# Altium schematic sheet 31_Ruedas.SchDoc
size A4; SheetNumber: 7; SheetTotal: 16
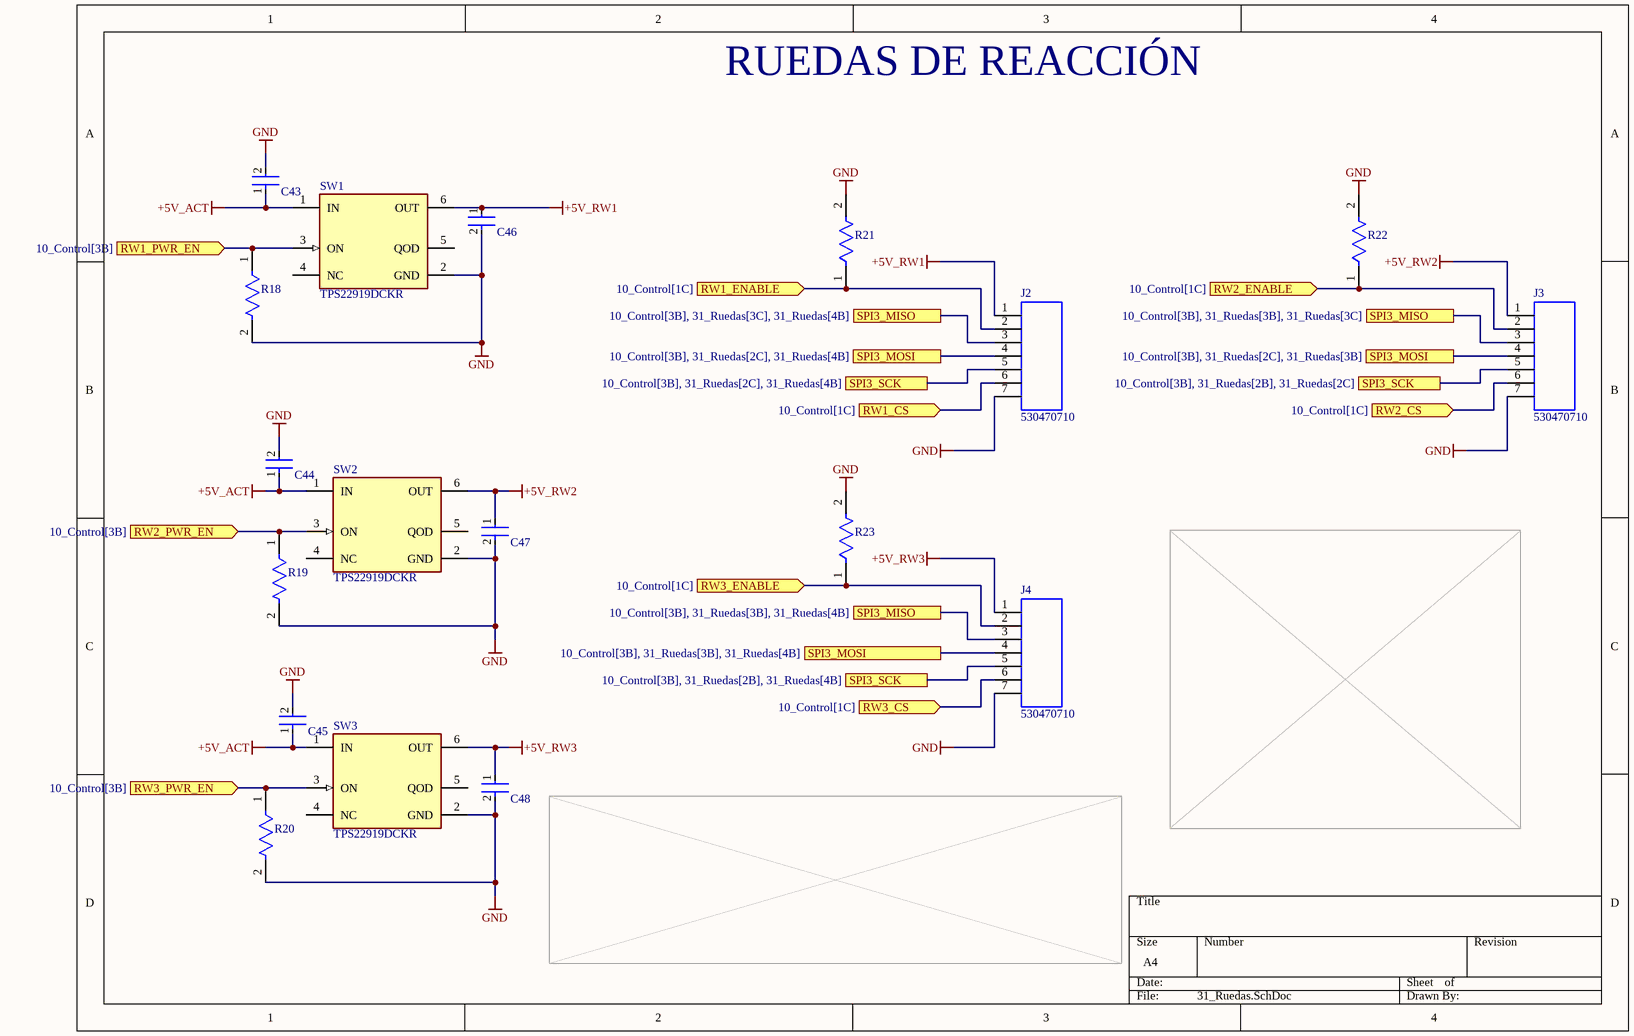
[diagram p0: 31_Ruedas.SchDoc]

## Parts
C43  C0603C104K3RACTU  [FP-C0603C-CF-IPC_B]  (value not drawn)
C44  C0603C104K3RACTU  [FP-C0603C-CF-IPC_B]  (value not drawn)
C45  C0603C104K3RACTU  [FP-C0603C-CF-IPC_B]  (value not drawn)
C46  GCM32ER71E106KA57K  [FP-GCM32E-0_3-IPC_B]  (value not drawn)
C47  GCM32ER71E106KA57K  [FP-GCM32E-0_3-IPC_B]  (value not drawn)
C48  GCM32ER71E106KA57K  [FP-GCM32E-0_3-IPC_B]  (value not drawn)
J2  530470710  [CONN07_530470710_MOL]
J3  530470710  [CONN07_530470710_MOL]
J4  530470710  [CONN07_530470710_MOL]
R18  RC0603FR-07100KL  [FP-RC0603-0_55-MFG]  (value not drawn)
R19  RC0603FR-07100KL  [FP-RC0603-0_55-MFG]  (value not drawn)
R20  RC0603FR-07100KL  [FP-RC0603-0_55-MFG]  (value not drawn)
R21  RC0603FR-07100KL  [FP-RC0603-0_55-MFG]  (value not drawn)
R22  RC0603FR-07100KL  [FP-RC0603-0_55-MFG]  (value not drawn)
R23  RC0603FR-07100KL  [FP-RC0603-0_55-MFG]  (value not drawn)
SW1  TPS22919DCKR  [FP-DCK0006A-IPC_A]
SW2  TPS22919DCKR  [FP-DCK0006A-IPC_A]
SW3  TPS22919DCKR  [FP-DCK0006A-IPC_A]

## Ports
RW1_CS (in, see 10_Control[1C]), RW1_ENABLE (in, see 10_Control[1C]), RW1_PWR_EN (in, see 10_Control[3B]), RW2_CS (in, see 10_Control[1C]), RW2_ENABLE (in, see 10_Control[1C]), RW2_PWR_EN (in, see 10_Control[3B]), RW3_CS (in, see 10_Control[1C]), RW3_ENABLE (in, see 10_Control[1C]), RW3_PWR_EN (in, see 10_Control[3B]), SPI3_MISO (see 10_Control[3B], 31_Ruedas[3B], 31_Ruedas[3C]), SPI3_MISO (see 10_Control[3B], 31_Ruedas[3B], 31_Ruedas[4B]), SPI3_MISO (see 10_Control[3B], 31_Ruedas[3C], 31_Ruedas[4B]), SPI3_MOSI (see 10_Control[3B], 31_Ruedas[2C], 31_Ruedas[3B]), SPI3_MOSI (see 10_Control[3B], 31_Ruedas[2C], 31_Ruedas[4B]), SPI3_MOSI (see 10_Control[3B], 31_Ruedas[3B], 31_Ruedas[4B]), SPI3_SCK (see 10_Control[3B], 31_Ruedas[2B], 31_Ruedas[2C]), SPI3_SCK (see 10_Control[3B], 31_Ruedas[2B], 31_Ruedas[4B]), SPI3_SCK (see 10_Control[3B], 31_Ruedas[2C], 31_Ruedas[4B])

## Nets
+5V_ACT: C43.1 C44.1 C45.1 SW1.1(IN) SW2.1(IN) SW3.1(IN)
+5V_RW1: C46.1 J2.1 SW1.6(OUT)
+5V_RW2: C47.1 J3.1 SW2.6(OUT)
+5V_RW3: C48.1 J4.1 SW3.6(OUT)
GND: C43.2 C44.2 C45.2 C46.2 C47.2 C48.2 J2.7 J3.7 J4.7 R18.2 R19.2 R20.2 R21.2 R22.2 R23.2 SW1.2(GND) SW2.2(GND) SW3.2(GND)
RW1_CS: J2.6 ; port RW1_CS
RW1_ENABLE: J2.2 R21.1 ; port RW1_ENABLE
RW1_PWR_EN: R18.1 SW1.3(ON) ; port RW1_PWR_EN
RW2_CS: J3.6 ; port RW2_CS
RW2_ENABLE: J3.2 R22.1 ; port RW2_ENABLE
RW2_PWR_EN: R19.1 SW2.3(ON) ; port RW2_PWR_EN
RW3_CS: J4.6 ; port RW3_CS
RW3_ENABLE: J4.2 R23.1 ; port RW3_ENABLE
RW3_PWR_EN: R20.1 SW3.3(ON) ; port RW3_PWR_EN
SPI3_MISO: J2.3 J3.3 J4.3 ; port SPI3_MISO
SPI3_MOSI: J2.4 J3.4 J4.4 ; port SPI3_MOSI
SPI3_SCK: J2.5 J3.5 J4.5 ; port SPI3_SCK

Not connected (* = marked no-connect by the designer): SW1 4(NC) 5(QOD); SW2 4(NC) 5(QOD); SW3 4(NC) 5(QOD)

## Notes on the sheet
- RUEDAS DE REACCIÓN

## Library data of the parts
C43-C45 = CMP-2006-03057-2: CAP CER 0.1UF 25V X7R 0603; Manufacturer: KEMET; Value: 0.10 μF; Material: Ceramic; Tolerance: 0.1; Temperature Coefficient: 30ppm/°C; Automotive Grade: Grade 1; Lead Free: Yes; Device Class L3: Ceramic Capacitors; Voltage Rating: 25 V; Manufacturer Part Number: C0603C104K3RACTU; Digikey Description: CAP CER 0.1UF 25V X7R 0603; Mouser Description: Multilayer Ceramic Capacitors MLCC - SMD/SMT 25volts 0.1uF X7R 10%; Package: C0603C-CF; Temperature Range Low: -55°C; Automotive: Yes; Device Class L2: Capacitors; Octopart: https://octopart.com/c0603c104k3ractu-kemet-127541; ComponentLink2Description: Datasheet; ComponentLink2URL: https://api.kemet.com/component-edge/download/datasheet/C0603C100J5GACAUTO.pdf; Temperature Range High: +125°C; RoHS: TRUE; Device Class L1: Passive Components; Category: Cap; Temperature: -55°C to +125°C; Capacitance: 0.10 μF; Height: 0.87mm; Temperature Characteristic: X7R
C46-C48 = CMP-2000-06320-2: Ceramic Capacitor for Automotive 10uF ±10% 25VDC X7R 1210 Embossed T/R; Voltage Rating (DC): 25V; Height: 2.5mm; Ratings: AEC-Q200; Termination: SMD/SMT; Case Code (Imperial): 1210; Packaging: Tape and Reel; Min Operating Temperature: -55°C; Radiation Hardening: No; Mount: Surface Mount; Depth: 2.5mm; Case Code (Metric): 3225; Length: 3.2mm; Tolerance: 10%; Package Quantity: 4000; Width: 0.098inch; Max Operating Temperature: 125°C; Thickness: 0.106inch; Case/Package: 1210; Capacitance: 10uF; Voltage Rating: 25V; Dielectric: X7R
J2-J4 = 530470710: Conn Shrouded Header (4 Sides) HDR 7 POS 1.25mm Solder ST Top Entry Thru-Hole PicoBladeâ„¢ Tray; MF: Molex; SnapEDA_Link: https://www.snapeda.com/parts/530470710/Molex/view-part/?ref=snap; Package: None; Value: *; MP: 530470710; Check_prices: https://www.snapeda.com/parts/530470710/Molex/view-part/?ref=eda
R18-R23 = CMP-2100-03662-2: RES SMD 100K OHM 1% 1/10W 0603; Voltage Rating (DC): 50V; Resistance: 100kR; Max Power Dissipation: 100mW; Temperature Coefficient: 100ppm/°C; Working Voltage: 75V; Length: 1.6mm; Lead Free: Lead Free; Number of Terminations: 2; Packaging: Tape and Reel; Voltage Rating: 50V; Termination: SMD/SMT; Width: 0.8mm; Resistor Type: Thick Film; Resistance Tolerance: 1%; Features: Moisture Resistant; Height: 0.45mm; Construction: Rectangular; Case/Package: 0603; Military Standard: Not; Case Code (Imperial): 0603; Series: RC; Technology: THICK FILM; Depth: 0.8mm; RoHS Compliant: Yes; REACH SVHC: No SVHC; Min Operating Temperature: -55°C; Case Code (Metric): 1608; Max Operating Temperature: 155°C; Power Rating: 100mW; Number of Pins: 2; Tolerance: 1%
SW1-SW3 = CMP-04912-000027-1: POWER MANAGEMENT